# Altium schematic sheet 11_20_MCU_CORE.SchDoc
size 289 x 396 mm
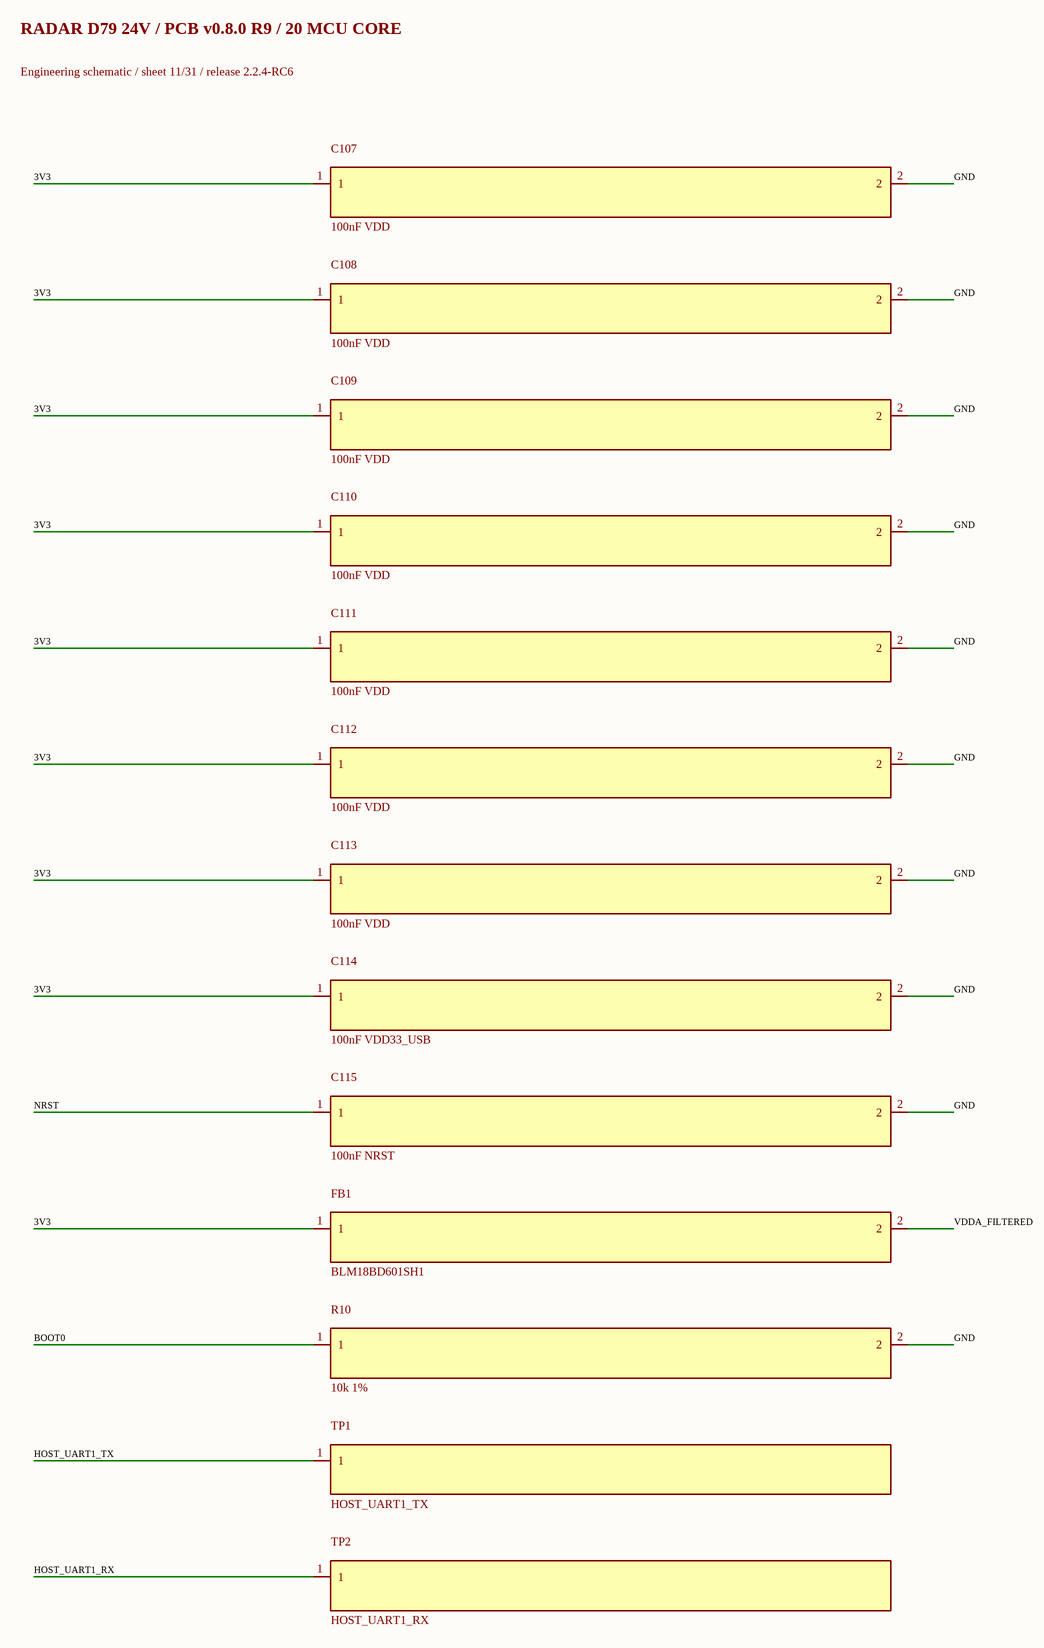
[diagram p0: 11_20_MCU_CORE.SchDoc]

## Parts
C107  100nF VDD  [C_0402_1005Metric]
C108  100nF VDD  [C_0402_1005Metric]
C109  100nF VDD  [C_0402_1005Metric]
C110  100nF VDD  [C_0402_1005Metric]
C111  100nF VDD  [C_0402_1005Metric]
C112  100nF VDD  [C_0402_1005Metric]
C113  100nF VDD  [C_0402_1005Metric]
C114  100nF VDD33_USB  [C_0402_1005Metric]
C115  100nF NRST  [C_0402_1005Metric]
FB1  BLM18BD601SH1  [L_0603_1608Metric]
R10  10k 1%  [R_0603_1608Metric]
TP1  HOST_UART1_TX  [TestPoint_Pad_D1.0mm]
TP2  HOST_UART1_RX  [TestPoint_Pad_D1.0mm]

## Nets
3V3: C107.1 C108.1 C109.1 C110.1 C111.1 C112.1 C113.1 C114.1 FB1.1
BOOT0: R10.1
GND: C107.2 C108.2 C109.2 C110.2 C111.2 C112.2 C113.2 C114.2 C115.2 R10.2
HOST_UART1_RX: TP2.1
HOST_UART1_TX: TP1.1
NRST: C115.1
VDDA_FILTERED: FB1.2

## Notes on the sheet
- RADAR D79 24V / PCB v0.8.0 R9 / 20 MCU CORE
- Engineering schematic / sheet 11/31 / release 2.2.4-RC6